# Altium schematic sheet 01_Power_Pump.SchDoc
size 406 x 279 mm
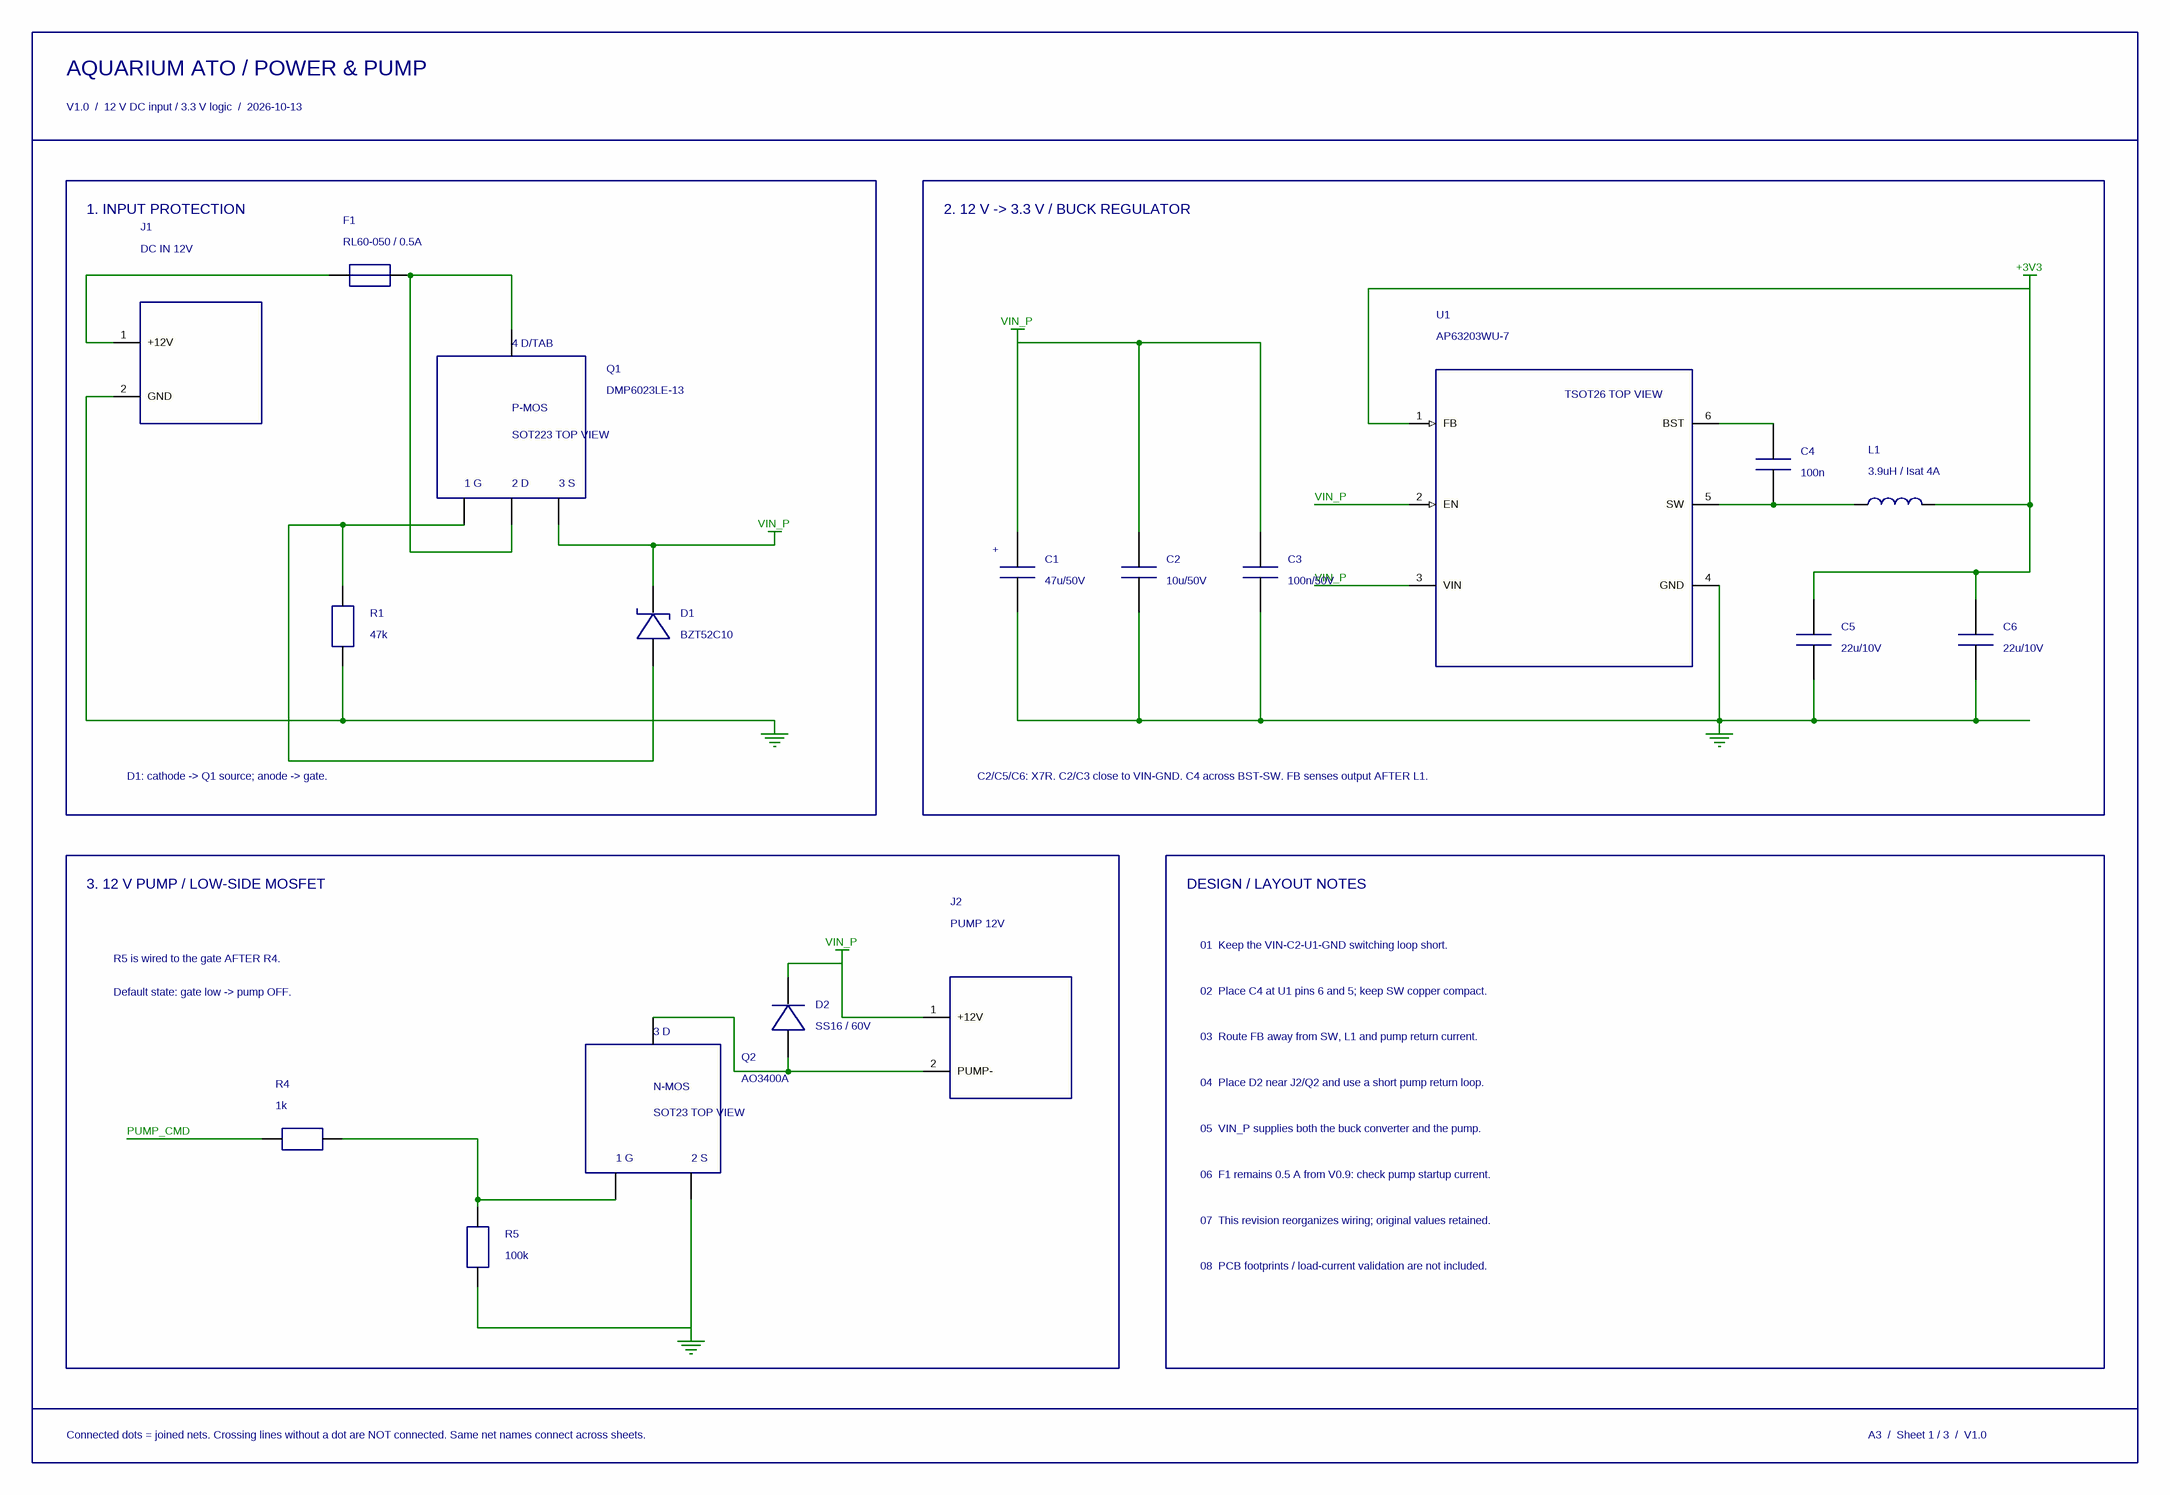
[diagram p0: 01_Power_Pump.SchDoc]

## Parts
C1  47u/50V  [CP_RADIAL_D8.0_P3.50]
C2  10u/50V  [C_1210_3225Metric]
C3  100n/50V  [C_0603_1608Metric]
C4  100n  [C_0603_1608Metric]
C5  22u/10V  [C_0805_2012Metric]
C6  22u/10V  [C_0805_2012Metric]
D1  BZT52C10  [SOD-123]
D2  SS16 / 60V  [D_SMA]
F1  RL60-050 / 0.5A  [PPTC_RADIAL_P5.10_D8.0]
J1  DC IN 12V  [TB_2P_P5.08]
J2  PUMP 12V  [TB_2P_P5.08]
L1  3.9uH / Isat 4A  [IND_SMD_6.0x6.0]
Q1  DMP6023LE-13  [SOT-223-4]
Q2  AO3400A  [SOT-23-3]
R1  47k  [R_0603_1608Metric]
R4  1k  [R_0603_1608Metric]
R5  100k  [R_0603_1608Metric]
U1  AP63203WU-7  [TSOT-23-6_P0.95]

## Blocks framed on the sheet
1. INPUT PROTECTION: D1 F1 J1 Q1 R1
2. 12 V -> 3.3 V / BUCK REGULATOR: C1-C6 L1 U1
3. 12 V PUMP / LOW-SIDE MOSFET: D2 J2 Q2 R4 R5

## Nets
+3V3: C5.1 C6.1 L1.2 U1.1(FB)
GND: C1.2 C2.2 C3.2 C5.2 C6.2 J1.2(GND) Q2.2(S) R1.2 R5.2 U1.4(GND)
VIN_P: C1.1 C2.1 C3.1 D1.1(K) D2.1(K) J2.1(+12V) Q1.3(S) U1.2(EN) U1.3(VIN)
PUMP_CMD: R4.1
NetC4_1: C4.1 U1.6(BST)
NetC4_2: C4.2 L1.1 U1.5(SW)
NetD1_2: D1.2(A) Q1.1(G) R1.1
NetD2_2: D2.2(A) J2.2(PUMP-) Q2.3(D)
NetF1_1: F1.1 J1.1(+12V)
NetF1_2: F1.2 Q1.2(D) Q1.4(D_/_TAB)
NetQ2_1: Q2.1(G) R4.2 R5.1

## Notes on the sheet
- AQUARIUM ATO / POWER & PUMP
- V1.0  /  12 V DC input / 3.3 V logic  /  2026-10-13
- D1: cathode -> Q1 source; anode -> gate.
- C2/C5/C6: X7R. C2/C3 close to VIN-GND. C4 across BST-SW. FB senses output AFTER L1.
- DESIGN / LAYOUT NOTES
- R5 is wired to the gate AFTER R4.
- 01  Keep the VIN-C2-U1-GND switching loop short.
- Default state: gate low -> pump OFF.
- 02  Place C4 at U1 pins 6 and 5; keep SW copper compact.
- 03  Route FB away from SW, L1 and pump return current.
- 04  Place D2 near J2/Q2 and use a short pump return loop.
- 05  VIN_P supplies both the buck converter and the pump.
- 06  F1 remains 0.5 A from V0.9: check pump startup current.
- 07  This revision reorganizes wiring; original values retained.
- 08  PCB footprints / load-current validation are not included.
- Connected dots = joined nets. Crossing lines without a dot are NOT connected. Same net names connect across sheets.
- A3  /  Sheet 1 / 3  /  V1.0
- (in symbol AP63203WU_7) TSOT26 TOP VIEW
- (in symbol CAPACITOR_POLARIZED_RADIAL) +
- (in symbol NMOS_AO3400A) 3 D; N-MOS; SOT23 TOP VIEW; 1 G; 2 S
- (in symbol PMOS_DMP6023LE) 4 D/TAB; P-MOS; SOT223 TOP VIEW; 1 G; 2 D; 3 S

## Library data of the parts
C1 = CAPACITOR_POLARIZED_RADIAL: 47u/50V; footprint CP_RADIAL_D8.0_P3.50
C2 = CAPACITOR_C_1210_3225METRIC: 10u/50V; footprint C_1210_3225Metric
C3 = CAPACITOR_C_0603_1608METRIC: 100n/50V; footprint C_0603_1608Metric
C4 = CAPACITOR_C_0603_1608METRIC: 100n; footprint C_0603_1608Metric
C5 C6 = CAPACITOR_C_0805_2012METRIC: 22u/10V; footprint C_0805_2012Metric
D1 = ZENER_DIODE: BZT52C10; package SOD-123; footprint SOD-123
D2 = DIODE: SS16 / 60V; package SMA; footprint D_SMA
F1 = PTC_RESETTABLE_FUSE: RL60-050 / 0.5A; package Radial leaded PPTC; footprint PPTC_RADIAL_P5.10_D8.0
J1 = DC_INPUT_2P: DC IN 12V; footprint TB_2P_P5.08
J2 = PUMP_OUTPUT_2P: PUMP 12V; footprint TB_2P_P5.08
L1 = INDUCTOR_6X6: 3.9uH / Isat 4A; footprint IND_SMD_6.0x6.0
Q1 = PMOS_DMP6023LE: DMP6023LE-13; package SOT223 (tab/pad 4 = drain); footprint SOT-223-4
Q2 = NMOS_AO3400A: AO3400A; package SOT23; footprint SOT-23-3
R1 = RESISTOR_0603: 47k; footprint R_0603_1608Metric
R4 = RESISTOR_0603: 1k; footprint R_0603_1608Metric
R5 = RESISTOR_0603: 100k; footprint R_0603_1608Metric
U1 = AP63203WU_7: AP63203WU-7; package TSOT26; footprint TSOT-23-6_P0.95